# Altium project DC-LAB-UPS-230V.PrjPcb
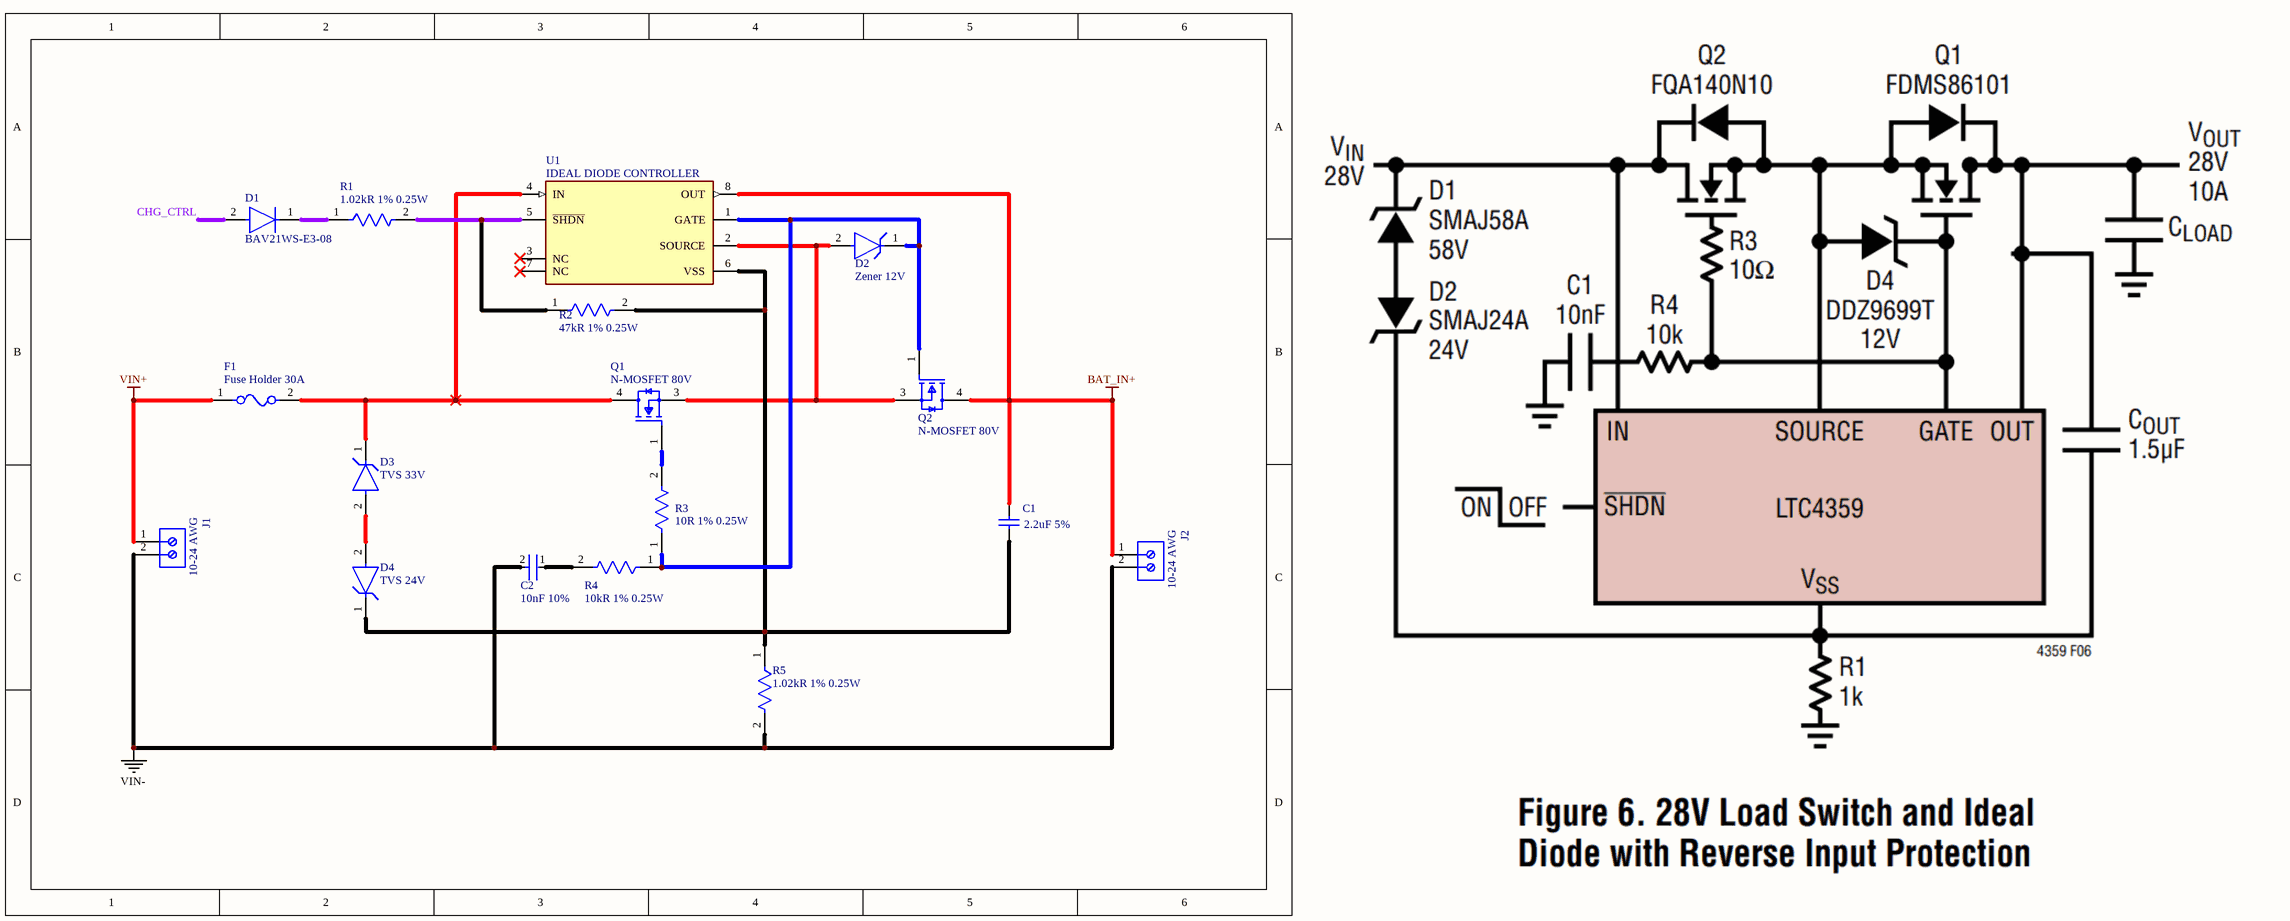
[diagram p0: Input_Stage.SchDoc]
3 sheets, 79 parts. Net scope: global (net labels, ports and power ports of the same name join across sheets).
Board file: DC-LAB-UPS-230V.PcbDoc
Sheets:
  Input_Stage.SchDoc
  Output_Stage.SchDoc
  Control_Stage.SchDoc

## Sheet Input_Stage.SchDoc
size 254 x 177 mm; SheetNumber: 1; SheetTotal: 3

### Parts
C1  2.2uF 5%  [WCAP-FTBP_L18W10H16.5]
C2  10nF 10%  [FP-C1608-080-0_1-MFG]
D1  BAV21WS-E3-08  [FP-S8-V-3910_02-001-MFG]
D2  Zener 12V  [FP-017AH-MFG]
D3  TVS 33V  [FP-SMCJ-MFG]
D4  TVS 24V  [FP-SMAJ-MFG]
F1  Fuse Holder 30A  [FP-3568-MFG]
J1  10-24 AWG  [PHOE-1714955_V]
J2  10-24 AWG  [PHOE-1714955_V]
Q1  N-MOSFET 80V  [FP-PG-TO263-3-MFG]
Q2  N-MOSFET 80V  [FP-PG-TO263-3-MFG]
R1  1.02kR 1% 0.25W  [FP-RT1206-MFG]
R2  47kR 1% 0.25W  [FP-RT1206-MFG]
R3  10R 1% 0.25W  [FP-RT1206-MFG]
R4  10kR 1% 0.25W  [FP-RT1206-MFG]
R5  1.02kR 1% 0.25W  [FP-RT1206-MFG]
U1  IDEAL DIODE CONTROLLER  [FP-S8-8-05-08-1610-IPC_C]

### Nets
BAT_IN+: C1.1 J2.1 Q2.4(D) U1.8(OUT)
VIN+: F1.1 J1.1
VIN-: C2.2 J1.2 J2.2 R5.2
CHG_CTRL: D1.2(A)
NetC1_2: C1.2 D4.1(C) R2.2 R5.1 U1.6(VSS)
NetC2_1: C2.1 R4.2
NetD1_1: D1.1(C) R1.1
NetD2_1: D2.1(C) Q2.1(G) R3.1 R4.1 U1.1(GATE)
NetD2_2: D2.2(A) Q1.3(S) Q2.3(S) U1.2(SOURCE)
NetD3_1: D3.1(C) F1.2 Q1.4(D) U1.4(IN)
NetD3_2: D3.2(A) D4.2(A)
NetQ1_1: Q1.1(G) R3.2
NetR1_2: R1.2 R2.1 U1.5(~{SHDN})

Not connected (* = marked no-connect by the designer): U1 3(NC)* 7(NC)*

### Library data of the parts
C1 = CMP-03913-89437347-3: 890443325010CS / Cap, 2.2Uf, 160V, Film, Radial Rohs Compliant: Yes; Insulation Resistance: 4.55GΩ; Pin Length: 4mm; Pitch: 15mm; ESR (Equivalent Series Resistance): 10.5mΩ; Capacitance: 2.2µF; Min Operating Temperature: -40°C; Width: 10mm; Packaging: Carton; RoHS: Compliant; Length: 18mm; Max Operating Temperature: 105°C; Voltage Rating: 160V; Height: 16.5mm
C2 = CMP-08246-003501-1: C1608X7R2A103K080AA / Multilayer Ceramic Capacitors 10nF ±10% 100V X7R SMD 0603; Voltage: 100V; Dielectric: X7R; Mount: Surface Mount; Packaging: Tape and Reel; Case/Package: 0603; Tolerance: 10%; Resistor Type: Ceramic; Case Code (Metric): 1608; Lead Free: Lead Free; RoHS Compliant: Yes; Radiation Hardening: No; Depth: 0.8mm; Thickness: 0.037inch; Length: 1.6mm; Case Code (Imperial): 0603; REACH SVHC: No SVHC; Min Operating Temperature: -55°C; Voltage Rating (DC): 100V; Series: C; Max Operating Temperature: 125°C; Construction: Flat; Number of Pins: 2; Package Quantity: 1; Termination: SMD/SMT; Voltage Rating: 100V; Capacitance: 10nF; Height: 0.8mm; Width: 0.8mm; Weight: 7.1E-05oz
D1 = CMP-02540-000084-1: DIODE GEN PURP 200V 250MA SOD323; Max Forward Surge Current (Ifsm): 1A; Max Surge Current: 625mA; Max Repetitive Reverse Voltage (Vrrm): 250V; Forward Voltage: 1.25V; Power Dissipation: 200mW; Reverse Recovery Time: 50ns; Element Configuration: Single; Max Reverse Current: 15uA; Forward Current: 200mA; Diode Capacitance-Max: 1.5pF; Max Reverse Leakage Current: 100nA; Contact Plating: Tin; Min Operating Temperature: -55°C; Package Quantity: 15000; Packaging: Tape and Reel; Lead Free: Lead Free; Case/Package: SOD-323-2; Series: Automotive, AEC-Q101; Number of Pins: 2; RoHS Compliant: Yes; Weight: 0.000152oz; Reverse Recovery Time-Max: 50ns; Mount: Surface Mount; Peak Non-Repetitive Surge Current: 1A; Max Reverse Voltage (DC): 200V; Max Power Dissipation: 200mW; Max Operating Temperature: 150°C; Average Rectified Current: 250mA
D2 = CMP-07164-000008-1: BZX85C12 / DIODE ZENER 12V 1W DO41; Manufacturer: ON Semiconductor; Max Zener Voltage: 12.7V; Zener Impedance: 9Ω; Reverse Voltage: 8.4V; Forward Current: 200mA; Max Reverse Leakage Current: 0.5uA; Max Junction Temp: +200°C; Device Class L3: Zener Diodes; Device Class L2: Diodes; ComponentLink2URL: https://www.onsemi.com/pub/Collateral/BZX85C3V3-D.PDF; Mouser Description: Zener Diodes 12V 1W Zener; Automotive: No; Ipc Land Pattern Name: DIOPA1088W105L520D272; Digikey Description: DIODE ZENER 12V 1W DO41; Power Dissipation: 1W; Temperature Range High: +200°C; Height: 2.72mm; Package: 017AH; RoHS: TRUE; Category: Diode; Lead Free: Yes; Octopart: https://octopart.com/bzx85c12-on+semiconductor-84409056; Device Class L1: Discrete Semiconductors; Nom Zener Voltage: 12V; Manufacturer Part Number: BZX85C12; Temperature Range Low: -65°C; Footprint Url: https://www.onsemi.com/pub/Collateral/017AH.PDF; Temperature: -65°C to +200°C; ComponentLink2Description: Datasheet
D3 = CMP-2000-07107-2: SMCJ33A / TVS DIODE 33V 53.3V DO214AB; Manufacturer: Littelfuse Inc; Breakdown Voltage: 36.7V; Number Of Channels: 1; Direction: Unidirectional; Peak Pulse Power: 1500W; Peak Pulse Current: 28.2A; Max Junction Temp: +150°C; Lead Free: Yes; Temperature Range High: +150°C; Device Class L1: Circuit Protection; Category: Diode; Package: SMCJ; Device Class L2: TVS Diodes; Manufacturer Part Number: SMCJ33A; Temperature Range Low: -65°C; Automotive: No; Reverse Standoff Voltage: 33V; Device Class L3: unset; Height: 2.62mm; RoHS: TRUE; Digikey Description: TVS DIODE 33V 53.3V DO214AB; Temperature: -65°C to +150°C; Mouser Description: Diode Transient Voltage Suppressor (TVS) Single Uni Directional 33V 1.5KW 2-Pin SMC T/R; Clamping Voltage: 53.3V; ComponentLink2URL: https://upverter.com/datasheet/776ad76c8c447792c68262141a14e01aaf7c6fbe.pdf; ComponentLink2Description: Datasheet; Octopart: https://octopart.com/smcj33a-littelfuse-351660
D4 = CMP-08607-000085-1: SMAJ24A / TVS DIODE 24V 38.9V DO214AC; Manufacturer: Littelfuse Inc; Direction: Unidirectional; Peak Pulse Power: 400W; Peak Pulse Current: 10.3A; Max Junction Temp: +150°C; Breakdown Voltage: 26.7V; Number Of Channels: 1; ComponentLink2Description: Datasheet; Device Class L3: unset; Height: 2.29mm; ComponentLink2URL: https://www.littelfuse.com/~/media/electronics/datasheets/tvs_diodes/littelfuse_tvs_diode_smaj_datasheet.pdf.pdf; Device Class L1: Circuit Protection; Package: SMAJ; Temperature Range High: +150°C; Device Class L2: TVS Diodes; Clamping Voltage: 38.9V; Reverse Standoff Voltage: 24V; Manufacturer Part Number: SMAJ24A; Mouser Description: In a Pack of 25, Littelfuse SMAJ24A, Uni-Directional TVS Diode, 400W, 2-Pin DO-214AC; Digikey Description: TVS DIODE 24V 38.9V DO214AC; Lead Free: Yes; Octopart: https://octopart.com/smaj24a-littelfuse-350003; Automotive: No; Temperature Range Low: -65°C; Category: Diode; RoHS: TRUE; Temperature: -65°C to +150°C
F1 = CMP-2000-05464-2: 3568; NexarPartId: 8116161; Approvals: UL; Body Material: Nylon; Illumination Type: Illuminated; Voltage Rating (AC): 500V; Current Rating: 20A; Number of Poles: 1; Color: Black; Material: Brass, Nylon, Tin; Depth: 6.73mm; Max Operating Temperature: 145°C; Length: 16mm; Mount: PCB, Vertical; REACH SVHC: No SVHC; Lead Free: Lead Free; Min Operating Temperature: -50°C; Flammability Rating: UL94 V-0; RoHS: Compliant; Orientation: Vertical; Fuse Current: 20A; Termination: PC Pin; Number of Circuits: 1; Contact Plating: Tin; Voltage: 500V; Contact Material: Brass
J1 J2 = CMP-2000-05797-1: 1714955 / PC Terminal Block, Pitch 6.35 mm, 1 x 2 Position, Height 21.5 mm, Tail Lenght 5.1 mm, RoHS, Bulk; Manufacturer: Phoenix Contact; Package Description: PC Terminal Block, Pitch 6.35 mm, 1 x 2 Position, Height 21.5 mm, Tail Lenght 5.1 mm; Datasheet URL: http://media.digikey.com/pdf/Data%20Sheets/Phoenix%20Contact%20PDFs/1714955.pdf; Package Reference: 1714955; Manufacturer URL: http://www.phoenixcontact.com/; Datasheet Version: 02/2010; Mounting Technology: ThroughHole
Q1 Q2 = CMP-32901-001127-1: IPB031N08N5ATMA1 / MOSFET N-CH 80V 120A D2PAK; Element Configuration: Single; Gate to Source Voltage (Vgs): 20V; Rise Time: 18ns; Rds On Max: 3.1mR; Drain to Source Resistance: 4.1mR; Number of Channels: 1; Fall Time: 12ns; Max Power Dissipation: 167W; Turn-Off Delay Time: 37ns; Polarity: N-CHANNEL; Input Capacitance: 6.24nF; Max Operating Temperature: 175°C; Packaging: Tape and Reel; Package Quantity: 1000; Lead Free: Contains Lead; Min Operating Temperature: -55°C; Drain to Source Voltage (Vdss): 80V; Mount: Surface Mount; Max Dual Supply Voltage: 80V; RoHS Compliant: Yes; Weight: 0.139332oz; Turn-On Delay Time: 18ns; Halogen Free: Halogen Free; Drain to Source Breakdown Voltage: 80V; Series: OptiMOS™; Case/Package: TO-263-3; Continuous Drain Current (ID): 120A; Number of Pins: 3
R1 R5 = CMP-03412-017249-1: RT1206FRE071K02L / RES SMD 1.02K OHM 1% 1/4W 1206; Manufacturer: Yageo; Resistance: 1.02KΩ; Voltage Rating: 200V; Value: 1.02KΩ; Temperature Coefficient: 50 ppm/°C; Tolerance: 0.0002; Automotive: No; Height: 0.65mm; Digikey Description: RES SMD 1.02K OHM 1% 1/4W 1206; Category: Res; ComponentLink2Description: Datasheet; ComponentLink2URL: http://www.yageo.com/documents/recent/PYu-RT_1-to-0.01_RoHS_L_9.pdf; Series: RT; Temperature Range High: +155°C; Device Class L2: Resistors; Octopart: https://octopart.com/rt1206fre071k02l-yageo-1242575; Temperature: -55°C to +155°C; Lead Free: Yes; Package: RT1206; Composition: Thin Film; Device Class L3: Chip SMD Resistors; RoHS: TRUE; Temperature Range Low: -55°C; Manufacturer Part Number: RT1206FRE071K02L; Power Rating: 0.25W; Ipc Land Pattern Name: RESC310160X55; Mouser Description: Thin Film Resistors - SMD 1/4W 1.02K ohm 1% 50ppm; Footprint Url: http://www.yageo.com/exep/pages/download/literatures/PYu-R_Mount_10.pdf; Device Class L1: Passive Components
R2 = CMP-2003-04092-2: RT1206FRE0747KL / RES SMD 47K OHM 1% 1/4W 1206; Manufacturer: Yageo; Voltage Rating: 200V; Value: 47KΩ; Tolerance: 0.0002; Temperature Coefficient: 50 ppm/°C; Category: Res; Digikey Description: RES SMD 47K OHM 1% 1/4W 1206; Device Class L3: Chip SMD Resistors; Lead Free: Yes; Octopart: https://octopart.com/rt1206fre0747kl-yageo-1208366; RoHS: TRUE; Ipc Land Pattern Name: RESC310160X55; Automotive: No; Series: RT; Power Rating: 0.25W; ComponentLink2Description: Datasheet; Mouser Description: Thin Film Resistors - SMD 1/4W 47K ohm 1% 50ppm; Composition: Thin Film; Temperature: -55°C to +155°C; Package: RT1206; Device Class L1: Passive Components; Resistance: 47KΩ; Device Class L2: Resistors; Manufacturer Part Number: RT1206FRE0747KL; Temperature Range Low: -55°C; Height: 0.65mm; ComponentLink2URL: http://www.yageo.com/documents/recent/PYu-RT_1-to-0.01_RoHS_L_9.pdf; Temperature Range High: +155°C; Footprint Url: http://www.yageo.com/exep/pages/download/literatures/PYu-R_Mount_10.pdf
R3 = CMP-2003-04091-2: RT1206FRE0710RL / RES SMD 10 OHM 1% 1/4W 1206; Manufacturer: Yageo; Temperature Coefficient: 50 ppm/°C; Value: 10Ω; Voltage Rating: 200V; Tolerance: 0.0002; Temperature Range Low: -55°C; Digikey Description: RES SMD 10 OHM 1% 1/4W 1206; Power Rating: 0.25W; Footprint Url: http://www.yageo.com/exep/pages/download/literatures/PYu-R_Mount_10.pdf; Octopart: https://octopart.com/rt1206fre0710rl-yageo-1385105; Lead Free: Yes; Temperature: -55°C to +155°C; Package: RT1206; Ipc Land Pattern Name: RESC310160X55; Device Class L2: Resistors; Composition: Thin Film; Category: Res; Series: RT; Automotive: No; RoHS: TRUE; Temperature Range High: +155°C; Manufacturer Part Number: RT1206FRE0710RL; Device Class L1: Passive Components; Height: 0.65mm; Device Class L3: Chip SMD Resistors; ComponentLink2Description: Datasheet; Mouser Description: High Precision-High Stability Chip Resistor Thin Film 1206 10Ohm 1% Paper T/R; ComponentLink2URL: http://www.yageo.com/documents/recent/PYu-RT_1-to-0.01_RoHS_L_9.pdf; Resistance: 10Ω
R4 = CMP-2003-04299-2: RT1206FRE0710KL / RES 10.0K OHM 1/4W 1% SMD 1206; Manufacturer: Yageo; Voltage Rating: 200V; Temperature Coefficient: 50 ppm/°C; Tolerance: 0.0002; Value: 10KΩ; Height: 0.65mm; Composition: Thin Film; Temperature Range Low: -55°C; Temperature Range High: +155°C; Device Class L2: Resistors; Power Rating: 0.25W; RoHS: TRUE; Digikey Description: RES 10.0K OHM 1/4W 1% SMD 1206; Manufacturer Part Number: RT1206FRE0710KL; Device Class L1: Passive Components; ComponentLink2URL: http://www.yageo.com/documents/recent/PYu-RT_1-to-0.01_RoHS_L_9.pdf; Category: Res; Lead Free: Yes; Mouser Description: Thin Film Resistors 1/4W 10K ohm 1% 50ppm; Octopart: https://octopart.com/rt1206fre0710kl-yageo-1169575; ComponentLink2Description: Datasheet; Footprint Url: http://www.yageo.com/exep/pages/download/literatures/PYu-R_Mount_10.pdf; Ipc Land Pattern Name: RESC310160X55; Package: RT1206; Automotive: No; Device Class L3: Chip SMD Resistors; Temperature: -55°C to +155°C; Series: RT; Resistance: 10KΩ
U1 = CMP-09131-000172-1: LTC4359IS8#PBF / IDEAL DIODE CONTROLLER WITH REVE; RoHS Compliant: Yes

## Sheet Output_Stage.SchDoc
size 558 x 190 mm; SheetNumber: 2; SheetTotal: 3
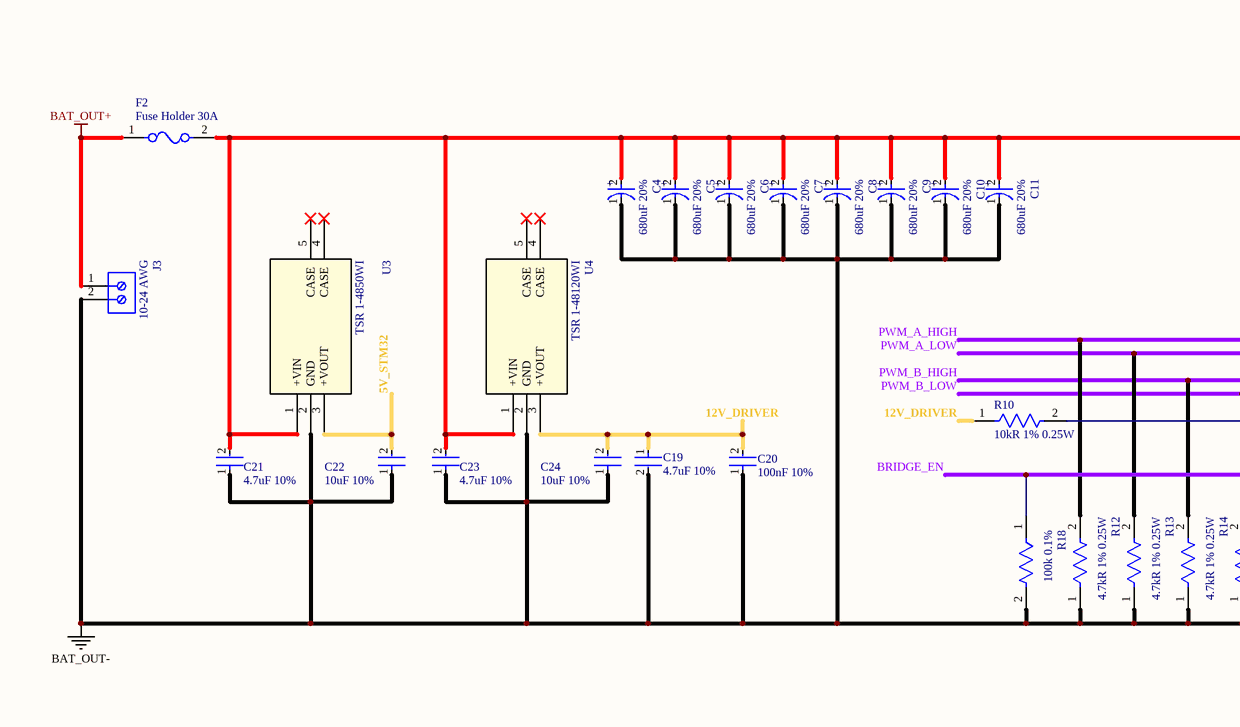
[diagram p1: Output_Stage.SchDoc, left]
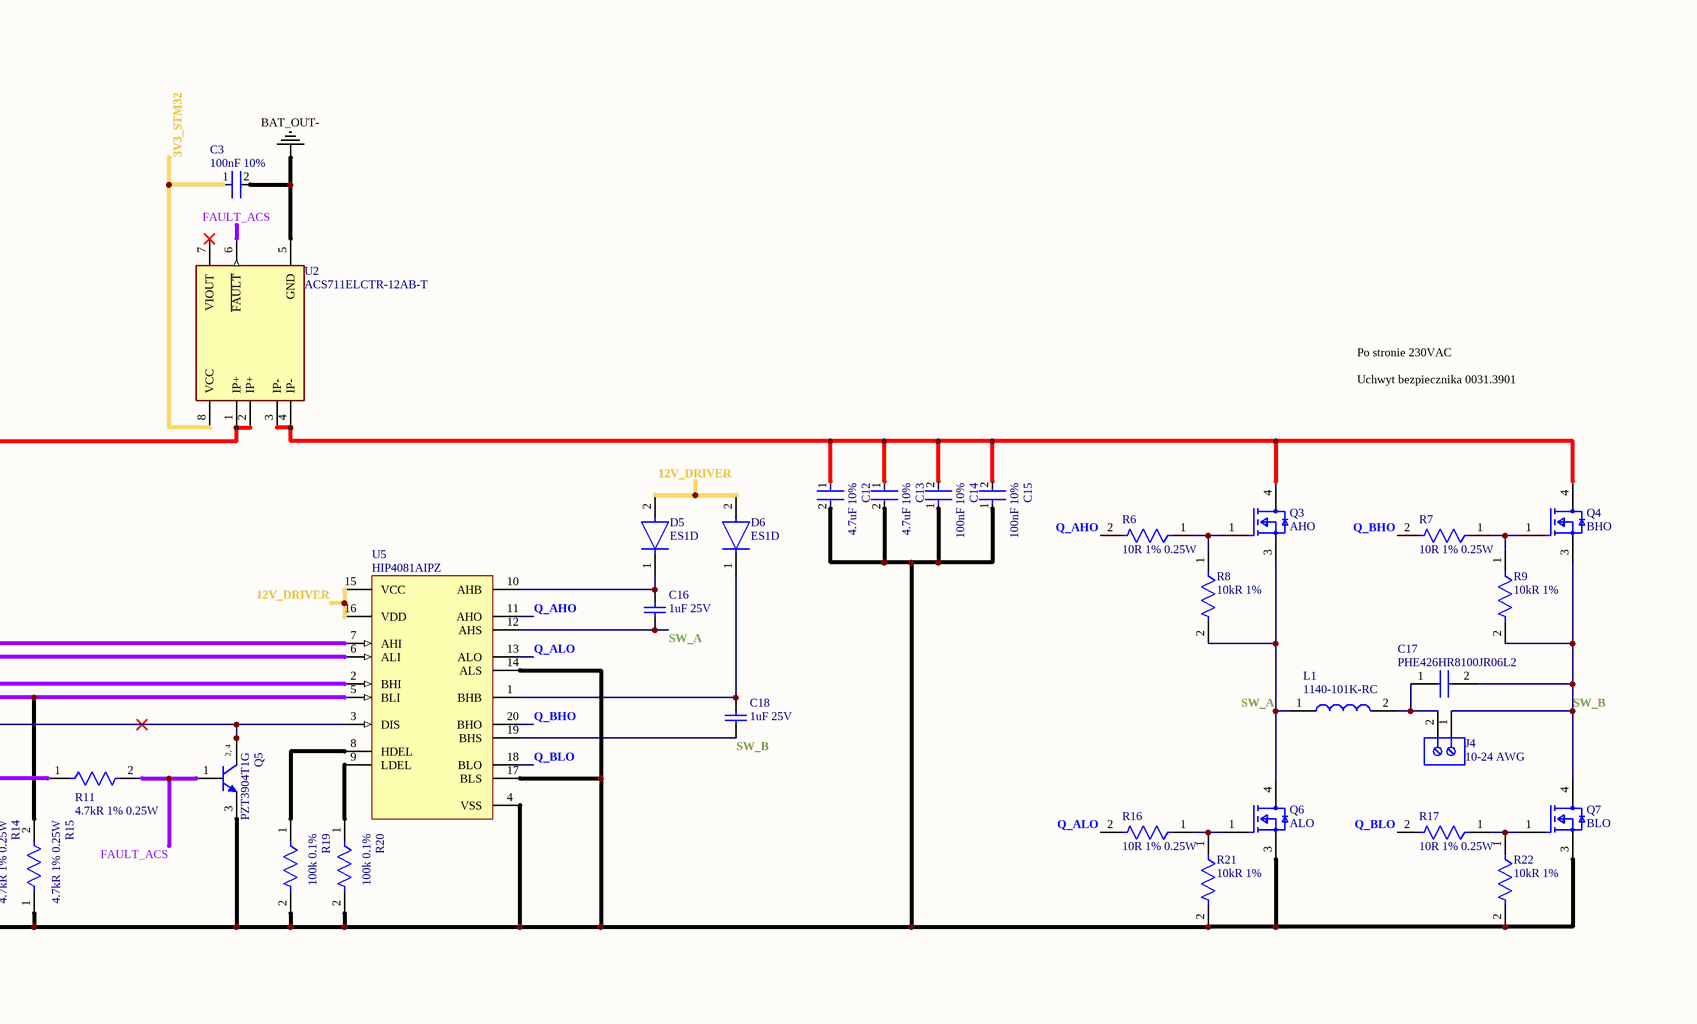
[diagram p2: Output_Stage.SchDoc, middle]
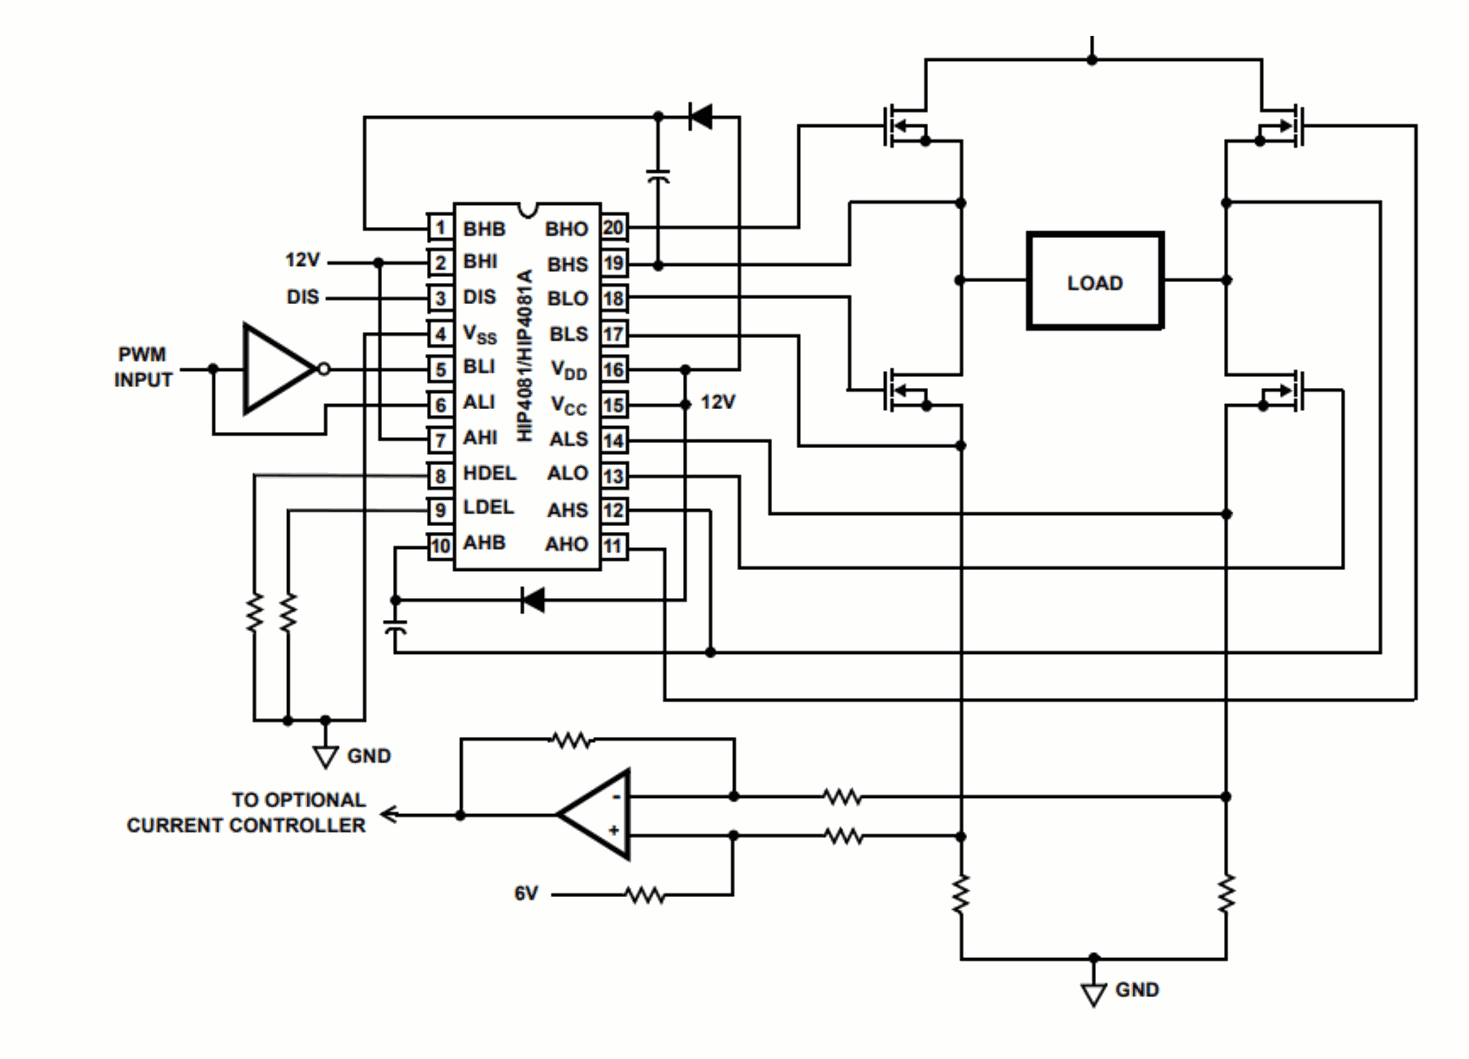
[diagram p3: Output_Stage.SchDoc, right]

### Parts
C3  100nF 10%  [FP-C0805C-DN-MFG]
C4  680uF 20%  [FP-RAD-TH-D_16_0_5-L_25_2-MFG]
C5  680uF 20%  [FP-RAD-TH-D_16_0_5-L_25_2-MFG]
C6  680uF 20%  [FP-RAD-TH-D_16_0_5-L_25_2-MFG]
C7  680uF 20%  [FP-RAD-TH-D_16_0_5-L_25_2-MFG]
C8  680uF 20%  [FP-RAD-TH-D_16_0_5-L_25_2-MFG]
C9  680uF 20%  [FP-RAD-TH-D_16_0_5-L_25_2-MFG]
C10  680uF 20%  [FP-RAD-TH-D_16_0_5-L_25_2-MFG]
C11  680uF 20%  [FP-RAD-TH-D_16_0_5-L_25_2-MFG]
C12  4.7uF 10%  [FP-CNA6P-MFG]
C13  4.7uF 10%  [FP-CNA6P-MFG]
C14  100nF 10%  [FP-C0805C-DN-MFG]
C15  100nF 10%  [FP-C0805C-DN-MFG]
C16  1uF 25V  [CAPC2013X140X50LL20T25]
C17  PHE426HR8100JR06L2  [PHE426HR8100JR06L2]
C18  1uF 25V  [CAPC2013X140X50LL20T25]
C19  4.7uF 10%  [FP-CNA6P-MFG]
C20  100nF 10%  [FP-C0805C-DN-MFG]
C21  4.7uF 10%  [FP-CNA6P-MFG]
C22  10uF 10%  [FP-C3225-250-0_4-MFG]
C23  4.7uF 10%  [FP-CNA6P-MFG]
C24  10uF 10%  [FP-C3225-250-0_4-MFG]
D5  ES1D  [FP-403AE-MFG]
D6  ES1D  [FP-403AE-MFG]
F2  Fuse Holder 30A  [FP-3568-MFG]
J3  10-24 AWG  [PHOE-1714955_V]
J4  10-24 AWG  [PHOE-1714955_V]
L1  1140-101K-RC  [1140101KRC]
Q3  AHO  [FP-PG-TO263-3-MFG]
Q4  BHO  [FP-PG-TO263-3-MFG]
Q5  PZT3904T1G  [ONSC-SOT-223-4-318E-04_V]
Q6  ALO  [FP-PG-TO263-3-MFG]
Q7  BLO  [FP-PG-TO263-3-MFG]
R6  10R 1% 0.25W  [FP-RT1206-MFG]
R7  10R 1% 0.25W  [FP-RT1206-MFG]
R8  10kR 1%  [FP-RT1206-MFG]
R9  10kR 1%  [FP-RT1206-MFG]
R10  10kR 1% 0.25W  [FP-RT1206-MFG]
R11  4.7kR 1% 0.25W  [FP-RT1206-MFG]
R12  4.7kR 1% 0.25W  [FP-RT1206-MFG]
R13  4.7kR 1% 0.25W  [FP-RT1206-MFG]
R14  4.7kR 1% 0.25W  [FP-RT1206-MFG]
R15  4.7kR 1% 0.25W  [FP-RT1206-MFG]
R16  10R 1% 0.25W  [FP-RT1206-MFG]
R17  10R 1% 0.25W  [FP-RT1206-MFG]
R18  100k 0.1%  [FP-RT1206-MFG]
R19  100k 0.1%  [FP-RT1206-MFG]
R20  100k 0.1%  [FP-RT1206-MFG]
R21  10kR 1%  [FP-RT1206-MFG]
R22  10kR 1%  [FP-RT1206-MFG]
U2  ACS711ELCTR-12AB-T  [FP-LC-8-IPC_C]
U3  TSR 1-4850WI  [TSR1WI-SINGLE_TRP]
U4  TSR 1-48120WI  [TSR1WI-SINGLE_TRP]
U5  HIP4081AIPZ  [DIP762W46P254L2590H533Q20_E20_3_N]

### Nets
BAT_OUT+: F2.1 J3.1
BAT_OUT-: C3.2 C4.1(C) C5.1(C) C6.1(C) C7.1(C) C8.1(C) C9.1(C) C10.1(C) C11.1(C) C12.2 C13.2 C14.1 C15.1 C19.2 C20.1 C21.1 C22.1 C23.1 C24.1 J3.2 Q5.3(E) Q6.3(S) Q7.3(S) R12.1 R13.1 R14.1 R15.1 R18.2 R19.2 R20.2 R21.2 R22.2 U2.5(GND) U3.2(GND) U4.2(GND) U5.4(VSS) U5.14(ALS) U5.17(BLS)
3V3_STM32: C3.1 U2.8(VCC)
5V_STM32: C22.2 U3.3(+VOUT)
12V_DRIVER: C19.1 C20.2 C24.2 D5.2(A) D6.2(A) R10.1 U4.3(+VOUT) U5.15(VCC) U5.16(VDD)
BRIDGE_EN: R11.1 R18.1
FAULT_ACS: Q5.1(B) R11.2 U2.6(~{FAULT})
PWM_A_HIGH: R12.2 U5.7(AHI)
PWM_A_LOW: R13.2 U5.6(ALI)
PWM_B_HIGH: R14.2 U5.2(BHI)
PWM_B_LOW: R15.2 U5.5(BLI)
Q_AHO: R6.2 U5.11(AHO)
Q_ALO: R16.2 U5.13(ALO)
Q_BHO: R7.2 U5.20(BHO)
Q_BLO: R17.2 U5.18(BLO)
SW_A: C16.2 L1.1 Q3.3(S) Q6.4(D) R8.2 U5.12(AHS)
SW_B: C17.2 C18.2 J4.1 Q4.3(S) Q7.4(D) R9.2 U5.19(BHS)
NetC4_2: C4.2(A) C5.2(A) C6.2(A) C7.2(A) C8.2(A) C9.2(A) C10.2(A) C11.2(A) C21.2 C23.2 F2.2 U2.1(IP+) U2.2(IP+) U3.1(+VIN) U4.1(+VIN)
NetC12_1: C12.1 C13.1 C14.2 C15.2 Q3.4(D) Q4.4(D) U2.3(IP-) U2.4(IP-)
NetC16_1: C16.1 D5.1(C) U5.10(AHB)
NetC17_1: C17.1 J4.2 L1.2
NetC18_1: C18.1 D6.1(C) U5.1(BHB)
NetQ3_1: Q3.1(G) R6.1 R8.1
NetQ4_1: Q4.1(G) R7.1 R9.1
NetQ5_2: Q5.2(C) Q5.4(C) R10.2 U5.3(DIS)
NetQ6_1: Q6.1(G) R16.1 R21.1
NetQ7_1: Q7.1(G) R17.1 R22.1
NetR19_1: R19.1 U5.8(HDEL)
NetR20_1: R20.1 U5.9(LDEL)

Not connected (* = marked no-connect by the designer): U2 7(VIOUT)*; U3 4(CASE)* 5(CASE)*; U4 4(CASE)* 5(CASE)*

### Notes on the sheet
- Po stronie 230VAC
  Uchwyt bezpiecznika 0031.3901
  Oraz wkładka bezpiecznikowa 0001.2501
- (in symbol CMP-1048-00481-1) 2, 4
- (in symbol CMP-05427-001257-1) +

### Library data of the parts
C3 C14 C15 C20 = CMP-2007-00279-2: C0805C104K5RACTU / CAP CER 0.1UF 50V X7R 0805; Manufacturer: KEMET; Value: 0.10 μF; Tolerance: 0.1; Temperature Coefficient: 30ppm/°C; Material: Ceramic; Manufacturer Part Number: C0805C104K5RACTU; Device Class L2: Capacitors; Temperature Range Low: -55°C; Voltage Rating: 50 V; Digikey Description: CAP CER 0.1UF 50V X7R 0805; Category: Cap; ComponentLink2Description: Datasheet; Octopart: https://octopart.com/c0805c104k5ractu-kemet-143926; RoHS: TRUE; ComponentLink2URL: https://content.kemet.com/datasheets/KEM_C1003_C0G_SMD.pdf; Temperature Characteristic: X7R; Temperature: -55°C to +125°C; Height: 0.88mm; Temperature Range High: +125°C; Device Class L1: Passive Components; Automotive: No; Lead Free: Yes; Ipc Land Pattern Name: CAPC200125X78; Device Class L3: Ceramic Capacitors; Mouser Description: Cap Ceramic 0.1uF 50V X7R 10% SMD 2.0 x 1.2 mm 125 C Paper T/R; Capacitance: 0.10 μF; Package: C0805C-DN
C4-C11 = CMP-05427-001257-1: EEUFS1K681B / Aluminum Electrolytic Capacitors (Radial Lead Type) 680uF ±20% 80V; RoHS Compliant: Yes
C12 C13 C19 C21 C23 = CMP-08246-000008-1: CNA6P1X7R2A475K250AE / CAP CER 4.7UF 100V X7R 1210; Manufacturer: TDK; Automotive Grade: Grade 1; Material: Ceramic; Temperature Coefficient: 15%; Temperature: -55°C to +125°C; Lead Free: Yes; RoHS: TRUE; Digikey Description: CAP CER 4.7UF 100V X7R 1210; Category: Cap; Device Class L1: Passive Components; Tolerance: 10%; ComponentLink2URL: https://product.tdk.com/info/en/catalog/datasheets/mlcc_automotive_soft_cna_en.pdf; Octopart: https://octopart.com/cna6p1x7r2a475k250ae-tdk-96979044; Device Class L3: Ceramic Capacitors; Height: 2.8mm; Voltage Rating: 100V; Value: 4.7uF; Temperature Range High: +125°C; Ipc Land Pattern Name: CAPC320250X250; Capacitance: 4.7uF; Temperature Characteristic: X7R; Package: CNA6P; Automotive: Yes; Manufacturer Part Number: CNA6P1X7R2A475K250AE; Temperature Range Low: -55°C; Device Class L2: Capacitors; ComponentLink2Description: Datasheet; Footprint Url: https://product.tdk.com/info/en/catalog/spec/mlccspec_automotive_soft_cna_en.pdf
C16 C18 = CMP-2007-03234-1: C0805C105K3RACTU; Manufacturer: Kemet; Part Number: C0805C105K3RACTU
C17 = PHE426HR8100JR06L2: Capacitor; Manufacturer_Name: Yageo Group; Datasheet Link: https://search.kemet.com/component-documentation/download/specsheet/F426RK106J250C; Height: 32mm; Manufacturer_Part_Number: PHE426HR8100JR06L2; Mouser Part Number: 80-PHE426HR8100JR6L2; Mouser Price/Stock: https://www.mouser.co.uk/ProductDetail/KEMET/PHE426HR8100JR06L2?qs=LpuuGx8iR2QFB19k2AHYGw%3D%3D
C22 C24 = CMP-08246-003742-1: C3225X7R1N106K250AC / Multilayer Ceramic Capacitors 10uF ±10% 75V X7R SMD 1210; RoHS Compliant: Yes
D5 D6 = CMP-2000-06230-3: DIODE GEN PURP 200V 1A SMA; Manufacturer: ON Semi; Peak Reverse Current: 5uA; Value: 7pF; Max Surge Forward Current: 30A; Max Junction Temp: +150°C; Standoff Height: 0.05mm; Temperature Range High: +150°C; Footprint Url: http://www.onsemi.com/pub/Collateral/403AE.PDF; Category: Diode; Device Class L3: Rectifier Diodes; RoHS: TRUE; Package: 403AE; Temperature Range Low: -50°C; Lead Free: Yes; Device Class L1: Discrete Semiconductors; ComponentLink2Description: Datasheet; Device Class L2: Diodes; Capacitance: 7pF; Temperature: -50°C to +150°C; Manufacturer Part Number: ES1D; Automotive: No; Max Repetitive Reverse Voltage: 200V; Octopart: https://octopart.com/es1d-on+semiconductor-84324855; ComponentLink2URL: https://www.onsemi.jp/PowerSolutions/document/ES1D-D.PDF; Height: 2.5mm; Forward Current: 1A; Digikey Description: DIODE GEN PURP 200V 1A SMA
F2 = CMP-2000-05464-2: as F1 on sheet Input_Stage; Depth: 6.73mm; Max Operating Temperature: 145°C; Length: 16mm; Mount: PCB, Vertical; REACH SVHC: No SVHC; Lead Free: Lead Free; Min Operating Temperature: -50°C; Flammability Rating: UL94 V-0; RoHS: Compliant; Orientation: Vertical; Fuse Current: 20A; Termination: PC Pin; Number of Circuits: 1; Contact Plating: Tin; Voltage: 500V; Contact Material: Brass
J3 J4 = CMP-2000-05797-1: as J1 on sheet Input_Stage; Package Description: PC Terminal Block, Pitch 6.35 mm, 1 x 2 Position, Height 21.5 mm, Tail Lenght 5.1 mm; Datasheet URL: http://media.digikey.com/pdf/Data%20Sheets/Phoenix%20Contact%20PDFs/1714955.pdf; Package Reference: 1714955; Manufacturer URL: http://www.phoenixcontact.com/; Datasheet Version: 02/2010; Mounting Technology: ThroughHole
L1 = 1140-101K-RC: Inductor; Manufacturer_Name: Bourns; Datasheet Link: http://www.bourns.com/docs/Product-Datasheets/1140_series.pdf; Height: 26.162mm; Manufacturer_Part_Number: 1140-101K-RC; Mouser Part Number: 542-1140-101K-RC; Mouser Price/Stock: https://www.mouser.co.uk/ProductDetail/Bourns/1140-101K-RC?qs=OvPYepjWVtSJktibIwUvvA%3D%3D; Arrow Part Number: 1140-101K-RC; Arrow Price/Stock: https://www.arrow.com/en/products/1140-101k-rc/bourns?region=europe
Q3 Q4 Q6 Q7 = CMP-32901-001127-1: as Q1 on sheet Input_Stage; Max Operating Temperature: 175°C; Packaging: Tape and Reel; Package Quantity: 1000; Lead Free: Contains Lead; Min Operating Temperature: -55°C; Drain to Source Voltage (Vdss): 80V; Mount: Surface Mount; Max Dual Supply Voltage: 80V; RoHS Compliant: Yes; Weight: 0.139332oz; Turn-On Delay Time: 18ns; Halogen Free: Halogen Free; Drain to Source Breakdown Voltage: 80V; Series: OptiMOS™; Case/Package: TO-263-3; Continuous Drain Current (ID): 120A; Number of Pins: 3
Q5 = CMP-1048-00481-1: General Purpose Transistor, NPN Silicon, 4-Pin SOT-223, Pb-Free, Tape and Reel; Manufacturer: On Semiconductor; IC Continuous (A): 0.2; fT Min (MHz): 300; PackageVersion: Rev. N, 08/2009; Mounting Technology: Surface Mount; PartNumber: PZT3904T1G; ComponentLink2Description: Datasheet; ComponentLink1Description: Manufacturer URL; Polarity: NPN; Packing: Tape and Reel; RoHS: TRUE; PackageReference: SOT-223-4-318E-04; PackageDescription: 4-Pin Small Outline Transistor, Body 6.5 x 3.5 mm, Pitch 2.3 mm; ComponentLink3Description: Package Specification; ComponentLink1URL: http://www.onsemi.com/; ComponentLink2URL: http://www.onsemi.com/pub_link/Collateral/PZT3904T1-D.PDF; DatasheetVersion: Rev. 6; ComponentLink3URL: http://www.onsemi.com/pub_link/Collateral/318E-04.PDF
R6 R7 R16 R17 = CMP-2003-04091-2: as R3 on sheet Input_Stage; Temperature Range Low: -55°C; Digikey Description: RES SMD 10 OHM 1% 1/4W 1206; Power Rating: 0.25W; Footprint Url: http://www.yageo.com/exep/pages/download/literatures/PYu-R_Mount_10.pdf; Octopart: https://octopart.com/rt1206fre0710rl-yageo-1385105; Lead Free: Yes; Temperature: -55°C to +155°C; Package: RT1206; Ipc Land Pattern Name: RESC310160X55; Device Class L2: Resistors; Composition: Thin Film; Category: Res; Series: RT; Automotive: No; RoHS: TRUE; Temperature Range High: +155°C; Manufacturer Part Number: RT1206FRE0710RL; Device Class L1: Passive Components; Height: 0.65mm; Device Class L3: Chip SMD Resistors; ComponentLink2Description: Datasheet; Mouser Description: High Precision-High Stability Chip Resistor Thin Film 1206 10Ohm 1% Paper T/R; ComponentLink2URL: http://www.yageo.com/documents/recent/PYu-RT_1-to-0.01_RoHS_L_9.pdf; Resistance: 10Ω
R8 R9 R21 R22 = CMP-2003-04299-2: RT1206FRE0710KL / RES 10.0K OHM 1/4W 1% SMD 1206; Manufacturer: Yageo; Power Rating: 0.25W; Voltage Rating: 200V; Temperature Coefficient: 50 ppm/°C; Tolerance: 0.0002; Value: 10KΩ; Height: 0.65mm; Composition: Thin Film; Temperature Range Low: -55°C; Temperature Range High: +155°C; Device Class L2: Resistors; RoHS: TRUE; Digikey Description: RES 10.0K OHM 1/4W 1% SMD 1206; Manufacturer Part Number: RT1206FRE0710KL; Device Class L1: Passive Components; ComponentLink2URL: http://www.yageo.com/documents/recent/PYu-RT_1-to-0.01_RoHS_L_9.pdf; Category: Res; Lead Free: Yes; Mouser Description: Thin Film Resistors 1/4W 10K ohm 1% 50ppm; Octopart: https://octopart.com/rt1206fre0710kl-yageo-1169575; ComponentLink2Description: Datasheet; Footprint Url: http://www.yageo.com/exep/pages/download/literatures/PYu-R_Mount_10.pdf; Ipc Land Pattern Name: RESC310160X55; Package: RT1206; Automotive: No; Device Class L3: Chip SMD Resistors; Temperature: -55°C to +155°C; Series: RT; Resistance: 10KΩ
R10 = CMP-2003-04299-2: as R4 on sheet Input_Stage; Height: 0.65mm; Composition: Thin Film; Temperature Range Low: -55°C; Temperature Range High: +155°C; Device Class L2: Resistors; Power Rating: 0.25W; RoHS: TRUE; Digikey Description: RES 10.0K OHM 1/4W 1% SMD 1206; Manufacturer Part Number: RT1206FRE0710KL; Device Class L1: Passive Components; ComponentLink2URL: http://www.yageo.com/documents/recent/PYu-RT_1-to-0.01_RoHS_L_9.pdf; Category: Res; Lead Free: Yes; Mouser Description: Thin Film Resistors 1/4W 10K ohm 1% 50ppm; Octopart: https://octopart.com/rt1206fre0710kl-yageo-1169575; ComponentLink2Description: Datasheet; Footprint Url: http://www.yageo.com/exep/pages/download/literatures/PYu-R_Mount_10.pdf; Ipc Land Pattern Name: RESC310160X55; Package: RT1206; Automotive: No; Device Class L3: Chip SMD Resistors; Temperature: -55°C to +155°C; Series: RT; Resistance: 10KΩ
R11-R15 = CMP-2003-04318-2: RT1206FRE074K7L / RES SMD 4.7K OHM 1% 1/4W 1206; Manufacturer: Yageo; Temperature Coefficient: 50 ppm/°C; Value: 4.7KΩ; Voltage Rating: 200V; Tolerance: 0.0002; Temperature Range Low: -55°C; Lead Free: Yes; Height: 0.65mm; Device Class L1: Passive Components; Temperature Range High: +155°C; Composition: Thin Film; Manufacturer Part Number: RT1206FRE074K7L; Device Class L2: Resistors; RoHS: TRUE; Automotive: No; Ipc Land Pattern Name: RESC310160X55; Series: RT; Temperature: -55°C to +155°C; Device Class L3: Chip SMD Resistors; Category: Res; Resistance: 4.7KΩ; Digikey Description: RES SMD 4.7K OHM 1% 1/4W 1206; Power Rating: 0.25W; ComponentLink2Description: Datasheet; Package: RT1206; Footprint Url: http://www.yageo.com/exep/pages/download/literatures/PYu-R_Mount_10.pdf; ComponentLink2URL: http://www.yageo.com/documents/recent/PYu-RT_1-to-0.01_RoHS_L_9.pdf; Mouser Description: Res Thin Film 1206 4.7K Ohm 1% 0.25W(1/4W) ?50ppm/C Molded SMD Paper T/R; Octopart: https://octopart.com/rt1206fre074k7l-yageo-1218966
R18-R20 = CMP-2003-04272-2: RT1206BRD07100KL / RES 100K OHM 1/4W .1% SMD 1206; Manufacturer: Yageo; Voltage Rating: 200V; Power Rating: 0.25W; Tolerance: 0.005; Temperature Coefficient: 25 ppm/°C; Value: 100KΩ; Ipc Land Pattern Name: RESC310160X55; Octopart: https://octopart.com/rt1206brd07100kl-yageo-1375718; ComponentLink2URL: http://www.yageo.com/documents/recent/PYu-RT_1-to-0.01_RoHS_L_9.pdf; ComponentLink2Description: Datasheet; Series: RT; Digikey Description: RES 100K OHM 1/4W .1% SMD 1206; Automotive: No; Device Class L1: Passive Components; Temperature Range High: +155°C; Temperature: -55°C to +155°C; Composition: Thin Film; Temperature Range Low: -55°C; Device Class L3: Chip SMD Resistors; Height: 0.65mm; Manufacturer Part Number: RT1206BRD07100KL; Mouser Description: Res Thin Film 1206 100K Ohm 0.1% 0.25W(1/4W) ±25ppm/C Epoxy Pad SMD T/R; Package: RT1206; Category: Res; Footprint Url: http://www.yageo.com/exep/pages/download/literatures/PYu-R_Mount_10.pdf; Resistance: 100KΩ; Device Class L2: Resistors; Lead Free: Yes; RoHS: TRUE
U2 = CMP-1557-00014-2: SENSOR CURRENT HALL 12.5A AC/DC; Response Time: 4.6us; Operating Supply Voltage: 3.3V; Frequency: 100kHz; Max Supply Current: 5.5mA; Sensitivity: 110mV/A; Number of Channels: 1; Accuracy: 5%; Polarity: Bidirectional; Linearity: 1%; Max Operating Temperature: 85°C; Min Operating Temperature: -40°C; Case/Package: SOIC; Package Quantity: 1; Series: -; -3db Bandwidth: 100kHz; Current Sensing: 12.5A; Packaging: Tape and Reel; RoHS Compliant: Yes; Number of Pins: 8
U3 = CMP-01539-104759533-1: TSR 1-4850WI DC-DC Converter, POL, Industrial, Encapsulated, 1A, 5V Out, 9-72V In; Output Power: 5W; NexarPartId: 104759533
U4 = CMP-01539-104759529-1: TSR 1-48120WI DC-DC Converter, POL, Industrial, Encapsulated, 1A, 12V Out, 17-72V In; Output Power: 12W; NexarPartId: 104759529
U5 = CMP-00572-88252434-2: Driver 2.5A 4-OUT Hi/Lo Side Full Brdg/Half Brdg Inv/Non-Inv Automotive 20-Pin PDIP Tube; Manufacturer Lifecycle Status: ACTIVE; Nominal Supply Current: 10.5mA; Max Supply Voltage: 15V; Pitch: 2.5mm; Number of Channels: 4; RAM Size: 32kB; Max Power Dissipation: 440mW; Turn-On Delay Time: 110ns; Fall Time: 10ns; Number of Drivers: 1; Output Voltage: 12.6V; Propagation Delay: 30ns; Overload Protection: Under Voltage; Min Supply Voltage: 9.5V; Turn-Off Delay Time: 90ns; Max Supply Current: 15.5mA; Switching Frequency: 1MHz; Number of Pins: 20; ComponentLink2Description: Datasheet URL; ComponentLink1Description: Manufacturer's Website; Max Output Current: 2.5A; Max Output Voltage: 15V; REACH SVHC: No; Packaging: Bulk; Min Operating Temperature: -40°C; Height: 3.94mm; ComponentLink2URL: https://octopart.com/cad-content/api/get-model-datasheet/15189/88252434; ComponentLink3Description: Manufacturer's Package Drawing; Lead Free: Lead Free; Export Control Classification Number (ECCN) Code: EAR99; HelpURL: https://octopart.com/cad-content/api/get-model-datasheet/15189/88252434; Max Operating Temperature: 85°C; Rise Time: 10ns; ComponentLink1URL: http://www.renesas.com; Width: 6.6mm; Number of Outputs: 4; ComponentLink3URL: https://www.renesas.com/en/document/psc/e203-20-lead-dual-line-plastic-packages; Lifecycle Status: Production; Length: 26.2mm; Output Current: 2.5A; Mount: Through Hole; Case/Package: PDIP; RoHS: Compliant

## Sheet Control_Stage.SchDoc
size 304 x 152 mm; SheetNumber: 3; SheetTotal: 3
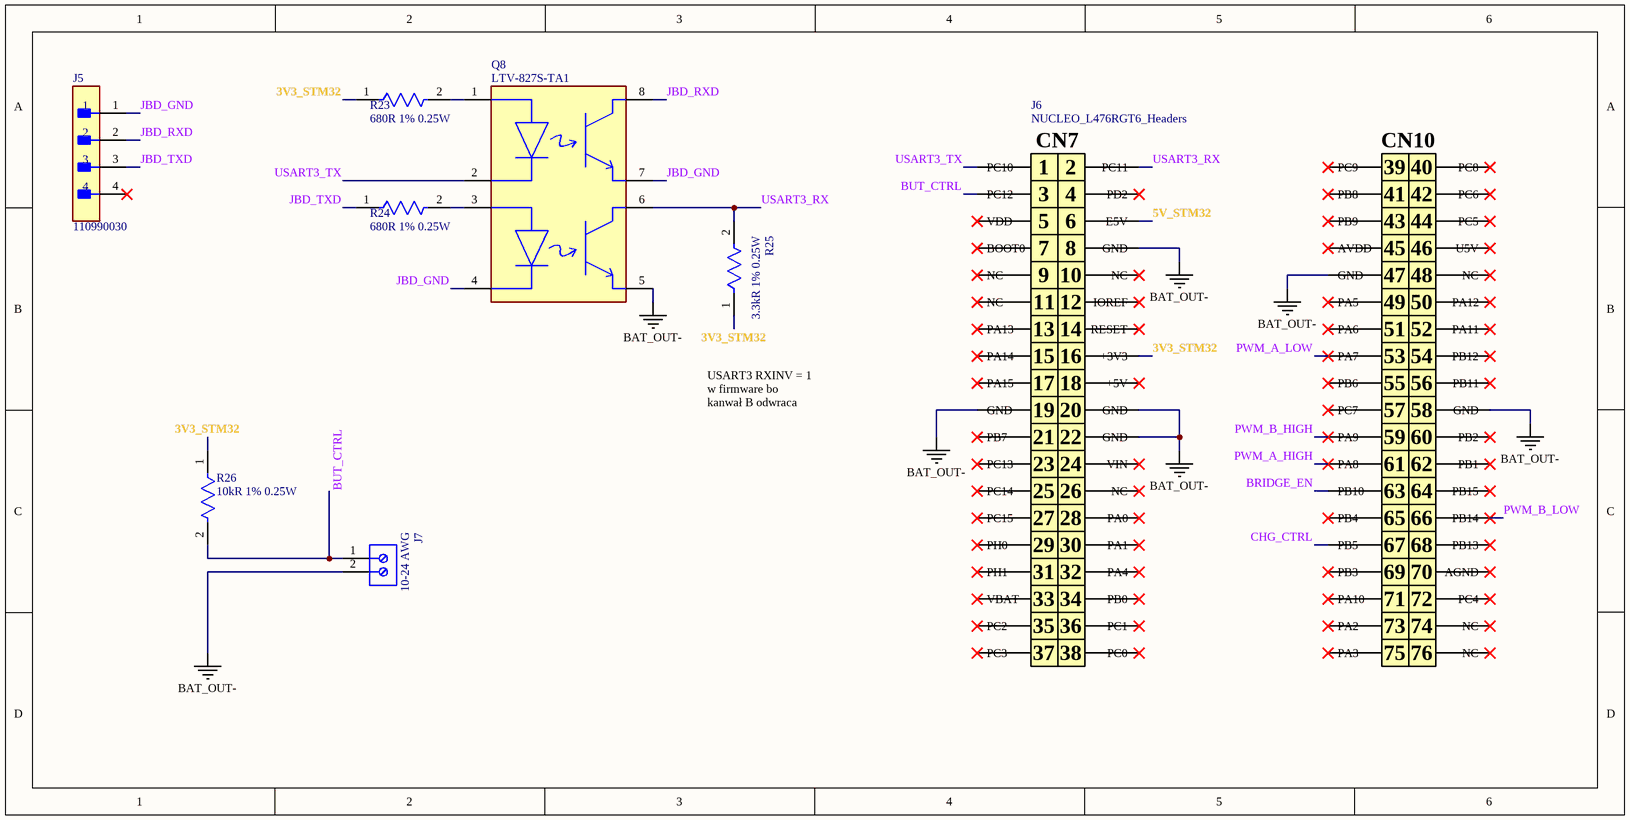
[diagram p4: Control_Stage.SchDoc]

### Parts
J5  110990030  [FP-110990030-MFG]
J6  NUCLEO_L476RGT6_Headers  [NUCLEO_L4764RGT6_Header]
J7  10-24 AWG  [PHOE-1714955_V]
Q8  LTV-827S-TA1  [FP-LTV-827S-TA1-MFG]
R23  680R 1% 0.25W  [FP-RT1206-MFG]
R24  680R 1% 0.25W  [FP-RT1206-MFG]
R25  3.3kR 1% 0.25W  [FP-RT1206-MFG]
R26  10kR 1% 0.25W  [FP-RT1206-MFG]

### Nets
BAT_OUT-: J6.8(GND) J6.19(GND) J6.20(GND) J6.22(GND) J6.47(GND) J6.58(GND) J7.2 Q8.5(E)
3V3_STM32: J6.16(+3V3) R23.1 R25.1 R26.1
5V_STM32: J6.6(E5V)
BRIDGE_EN: J6.63(PB10)
BUT_CTRL: J6.3(PC12) J7.1 R26.2
CHG_CTRL: J6.67(PB5)
JBD_GND: J5.1 Q8.4(2_Cathode) Q8.7(E)
JBD_RXD: J5.2 Q8.8(C)
JBD_TXD: J5.3 R24.1
PWM_A_HIGH: J6.61(PA8)
PWM_A_LOW: J6.53(PA7)
PWM_B_HIGH: J6.59(PA9)
PWM_B_LOW: J6.66(PB14)
USART3_RX: J6.2(PC11) Q8.6(C) R25.2
USART3_TX: J6.1(PC10) Q8.2(1_Cathode)
NetQ8_1: Q8.1(1_Anode) R23.2
NetQ8_3: Q8.3(2_Anode) R24.2

Not connected (* = marked no-connect by the designer): J5 4*; J6 4(PD2)* 5(VDD)* 7(BOOT0)* 9(NC)* 10(NC)* 11(NC)* 12(IOREF)* 13(PA13)* 14(RESET)* 15(PA14)* 17(PA15)* 18(+5V)* 21(PB7)* 23(PC13)* 24(VIN)* 25(PC14)* 26(NC)* 27(PC15)* 28(PA0)* 29(PH0)* 30(PA1)* 31(PH1)* 32(PA4)* 33(VBAT)* 34(PB0)* 35(PC2)* 36(PC1)* 37(PC3)* 38(PC0)* 39(PC9)* 40(PC8)* 41(PB8)* 42(PC6)* 43(PB9)* 44(PC5)* 45(AVDD)* 46(U5V)* 48(NC)* 49(PA5)* 50(PA12)* 51(PA6)* 52(PA11)* 54(PB12)* 55(PB6)* 56(PB11)* 57(PC7)* 60(PB2)* 62(PB1)* 64(PB15)* 65(PB4)* 68(PB13)* 69(PB3)* 70(AGND)* 71(PA10)* 72(PC4)* 73(PA2)* 74(NC)* 75(PA3)* 76(NC)*

### Notes on the sheet
- USART3 RXINV = 1 w firmware bo kanwał B odwraca sygnał
- (in symbol NUCLEO_L476RGT6_Headers) CN7; CN10

### Library data of the parts
J5 = CMP-139044-000001-1: GROVE 2MM 4PIN VERT CONN 10PCS; Series: -
J6 = NUCLEO_L476RGT6_Headers: Headers for NUCLEO L476RG T6 Board.; Manufacturer:: Amphenol FCI; Manufacturer Part Number:: 76342-319LF; Supplier 1:: Mouser; Supplier Part Number 1:: 649-76342-319LF; ComponentLink1Description: Mouser Link; ComponentLink1URL: https://www.mouser.pl/ProductDetail/Amphenol-FCI/76342-319LF?qs=5xI8GKdkXlkDdCCMwMnBAg%3D%3D
J7 = CMP-2000-05797-1: as J1 on sheet Input_Stage; Package Description: PC Terminal Block, Pitch 6.35 mm, 1 x 2 Position, Height 21.5 mm, Tail Lenght 5.1 mm; Datasheet URL: http://media.digikey.com/pdf/Data%20Sheets/Phoenix%20Contact%20PDFs/1714955.pdf; Package Reference: 1714955; Manufacturer URL: http://www.phoenixcontact.com/; Datasheet Version: 02/2010; Mounting Technology: ThroughHole
Q8 = CMP-22018-000005-1: OPTOISOLATOR 5KV 2CH TRANS 8-SMD; Number of Channels: 2; Forward Current: 50mA; Reverse Breakdown Voltage: 6V; Current Transfer Ratio: 600%; Collector Emitter Saturation Voltage: 200mV; Collector Emitter Voltage (VCEO): 35V; Max Power Dissipation: 200mW; Rise Time: 18000ns; Forward Voltage: 1.4V; Number of Elements: 2; Min Operating Temperature: -30°C; Number of Circuits: 2; Max Collector Current: 50mA; Packaging: Tape and Reel; Max Input Current: 50mA; Case/Package: SMD/SMT; Radiation Hardening: No; Package Quantity: 1000; Max Output Voltage: 35V; Output Current per Channel: 50mA; Fall Time: 18000ns; Mount: Surface Mount; Isolation Voltage: 5kV; Power Dissipation: 200mW; Lead Free: Lead Free; Max Operating Temperature: 110°C; Output Voltage: 35V; Number of Pins: 8
R23 R24 = CMP-2003-04104-2: RT1206FRE07680RL / RES SMD 680 OHM 1% 1/4W 1206; Manufacturer: Yageo; Description: RT1206 680Ω 0.25W 50 ppm/°C 0.02%; Resistance: 680Ω; Value: 680Ω; Temperature Coefficient: 50 ppm/°C; Tolerance: 0.0002; Voltage Rating: 200V; Device Class L3: Chip SMD Resistors; RoHS: TRUE; Digikey Description: RES SMD 680 OHM 1% 1/4W 1206; Lead Free: Yes; Mouser Description: Res Thin Film 1206 680 Ohm 1% 1/4W ±50ppm/°C Molded SMD SMD Paper T/R; Temperature Range Low: -55°C; Category: Res; ComponentLink2URL: http://www.yageo.com/documents/recent/PYu-RT_1-to-0.01_RoHS_L_9.pdf; Ipc Land Pattern Name: RESC310160X55; Octopart: https://octopart.com/rt1206fre07680rl-yageo-1466321; Series: RT; Device Class L2: Resistors; Device Class L1: Passive Components; ComponentLink2Description: Datasheet; Temperature: -55°C to +155°C; Automotive: No; Composition: Thin Film; Manufacturer Part Number: RT1206FRE07680RL; Power Rating: 0.25W; Footprint Url: http://www.yageo.com/exep/pages/download/literatures/PYu-R_Mount_10.pdf; Temperature Range High: +155°C; Package: RT1206; Height: 0.65mm
R25 = CMP-2003-04314-2: RT1206FRE073K3L / RES SMD 3.3K OHM 1% 1/4W 1206; Manufacturer: Yageo; Temperature Coefficient: 50 ppm/°C; Description: RT1206 3.3KΩ 0.25W 50 ppm/°C 0.02%; Resistance: 3.3KΩ; Value: 3.3KΩ; Voltage Rating: 200V; Tolerance: 0.0002; Manufacturer Part Number: RT1206FRE073K3L; Height: 0.65mm; ComponentLink2Description: Datasheet; Lead Free: Yes; Temperature: -55°C to +155°C; Digikey Description: RES SMD 3.3K OHM 1% 1/4W 1206; Temperature Range High: +155°C; Category: Res; Footprint Url: http://www.yageo.com/exep/pages/download/literatures/PYu-R_Mount_10.pdf; Device Class L2: Resistors; Package: RT1206; Device Class L1: Passive Components; RoHS: TRUE; ComponentLink2URL: http://www.yageo.com/documents/recent/PYu-RT_1-to-0.01_RoHS_L_9.pdf; Device Class L3: Chip SMD Resistors; Temperature Range Low: -55°C; Octopart: https://octopart.com/rt1206fre073k3l-yageo-1236583; Automotive: No; Composition: Thin Film; Mouser Description: Thin Film Resistors - SMD 1/4W 3.3K ohm 1% 50ppm; Ipc Land Pattern Name: RESC310160X55; Series: RT; Power Rating: 0.25W
R26 = CMP-2003-04299-2: as R4 on sheet Input_Stage; Height: 0.65mm; Composition: Thin Film; Temperature Range Low: -55°C; Temperature Range High: +155°C; Device Class L2: Resistors; Power Rating: 0.25W; RoHS: TRUE; Digikey Description: RES 10.0K OHM 1/4W 1% SMD 1206; Manufacturer Part Number: RT1206FRE0710KL; Device Class L1: Passive Components; ComponentLink2URL: http://www.yageo.com/documents/recent/PYu-RT_1-to-0.01_RoHS_L_9.pdf; Category: Res; Lead Free: Yes; Mouser Description: Thin Film Resistors 1/4W 10K ohm 1% 50ppm; Octopart: https://octopart.com/rt1206fre0710kl-yageo-1169575; ComponentLink2Description: Datasheet; Footprint Url: http://www.yageo.com/exep/pages/download/literatures/PYu-R_Mount_10.pdf; Ipc Land Pattern Name: RESC310160X55; Package: RT1206; Automotive: No; Device Class L3: Chip SMD Resistors; Temperature: -55°C to +155°C; Series: RT; Resistance: 10KΩ

## Nets that join several sheets
BAT_OUT-: Output_Stage (38 pins), Control_Stage (8 pins)
3V3_STM32: Output_Stage (C3.1 U2.8), Control_Stage (J6.16 R23.1 R25.1 R26.1)
5V_STM32: Output_Stage (C22.2 U3.3), Control_Stage (J6.6)
BRIDGE_EN: Output_Stage (R11.1 R18.1), Control_Stage (J6.63)
CHG_CTRL: Input_Stage (D1.2), Control_Stage (J6.67)
PWM_A_HIGH: Output_Stage (R12.2 U5.7), Control_Stage (J6.61)
PWM_A_LOW: Output_Stage (R13.2 U5.6), Control_Stage (J6.53)
PWM_B_HIGH: Output_Stage (R14.2 U5.2), Control_Stage (J6.59)
PWM_B_LOW: Output_Stage (R15.2 U5.5), Control_Stage (J6.66)